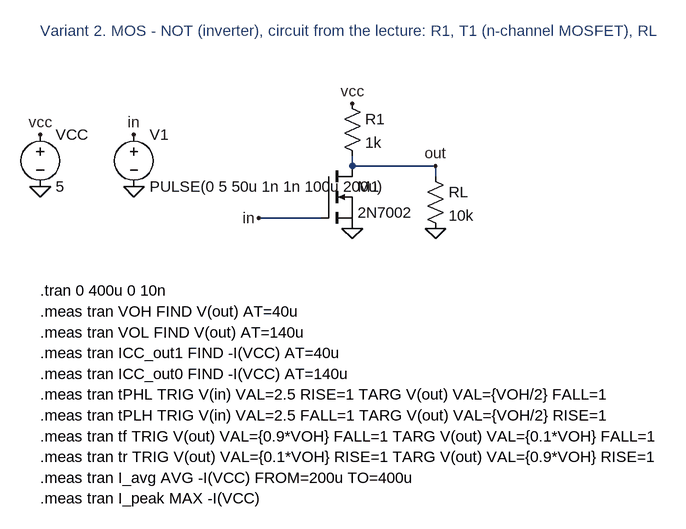
[diagram p0: schematic 3_MOS_NOT.asc]
3_MOS_NOT.asc, the LTspice schematic file:
Version 4
SHEET 1 1400 760
SYMBOL voltage -288 32 R0
SYMATTR InstName VCC
SYMATTR Value 5
FLAG -288 48 vcc
FLAG -288 128 0
SYMBOL voltage -144 32 R0
SYMATTR InstName V1
SYMATTR Value PULSE(0 5 50u 1n 1n 100u 200u)
FLAG -144 48 in
FLAG -144 128 0
SYMBOL nmos 144 96 R0
SYMATTR InstName M1
SYMATTR Value 2N7002
SYMBOL res 176 -16 R0
SYMATTR InstName R1
SYMATTR Value 1k
FLAG 192 0 vcc
WIRE 192 80 192 96
WIRE 192 96 320 96
FLAG 320 96 out
SYMBOL res 304 96 R0
SYMATTR InstName RL
SYMATTR Value 10k
WIRE 320 96 320 112
FLAG 320 192 0
WIRE 144 176 48 176
FLAG 48 176 in
FLAG 192 192 0
TEXT -288 -112 Left 2 ;Variant 2. MOS - NOT (inverter), circuit from the lecture: R1, T1 (n-channel MOSFET), RL
TEXT -288 288 Left 2 !.tran 0 400u 0 10n
TEXT -288 320 Left 2 !.meas tran VOH FIND V(out) AT=40u
TEXT -288 352 Left 2 !.meas tran VOL FIND V(out) AT=140u
TEXT -288 384 Left 2 !.meas tran ICC_out1 FIND -I(VCC) AT=40u
TEXT -288 416 Left 2 !.meas tran ICC_out0 FIND -I(VCC) AT=140u
TEXT -288 448 Left 2 !.meas tran tPHL TRIG V(in) VAL=2.5 RISE=1 TARG V(out) VAL={VOH/2} FALL=1
TEXT -288 480 Left 2 !.meas tran tPLH TRIG V(in) VAL=2.5 FALL=1 TARG V(out) VAL={VOH/2} RISE=1
TEXT -288 512 Left 2 !.meas tran tf TRIG V(out) VAL={0.9*VOH} FALL=1 TARG V(out) VAL={0.1*VOH} FALL=1
TEXT -288 544 Left 2 !.meas tran tr TRIG V(out) VAL={0.1*VOH} RISE=1 TARG V(out) VAL={0.9*VOH} RISE=1
TEXT -288 576 Left 2 !.meas tran I_avg AVG -I(VCC) FROM=200u TO=400u
TEXT -288 608 Left 2 !.meas tran I_peak MAX -I(VCC)

The netlist it stands for:
* 3_MOS_NOT.asc
VCC vcc 0 5
V1 in 0 PULSE(0 5 50u 1n 1n 100u 200u)
M1 out in 0 0 2N7002
R1 vcc out 1k
RL out 0 10k
.model NMOS NMOS
.model PMOS PMOS
.lib standard.mos
* Variant 2. MOS - NOT (inverter), circuit from the lecture: R1, T1 (n-channel MOSFET), RL
.tran 0 400u 0 10n
.meas tran VOH FIND V(out) AT=40u
.meas tran VOL FIND V(out) AT=140u
.meas tran ICC_out1 FIND -I(VCC) AT=40u
.meas tran ICC_out0 FIND -I(VCC) AT=140u
.meas tran tPHL TRIG V(in) VAL=2.5 RISE=1 TARG V(out) VAL={VOH/2} FALL=1
.meas tran tPLH TRIG V(in) VAL=2.5 FALL=1 TARG V(out) VAL={VOH/2} RISE=1
.meas tran tf TRIG V(out) VAL={0.9*VOH} FALL=1 TARG V(out) VAL={0.1*VOH} FALL=1
.meas tran tr TRIG V(out) VAL={0.1*VOH} RISE=1 TARG V(out) VAL={0.9*VOH} RISE=1
.meas tran I_avg AVG -I(VCC) FROM=200u TO=400u
.meas tran I_peak MAX -I(VCC)
.backanno
.end